# Altium schematic sheet Connector_Section.SchDoc
size A; DocumentNumber: 8; SheetNumber: 8; SheetTotal: 8
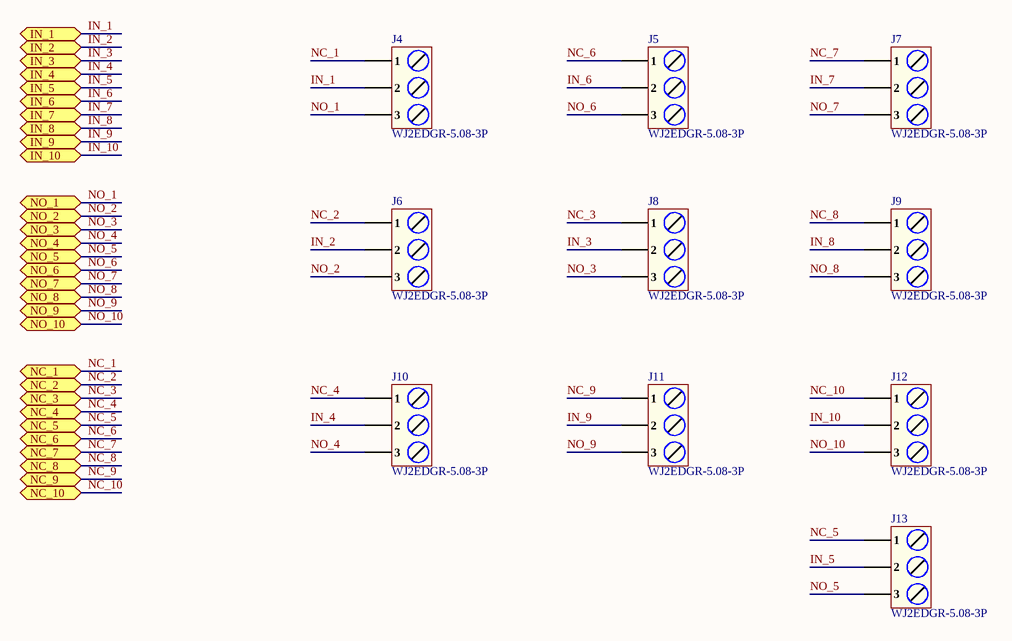
[diagram p0: Connector_Section.SchDoc]

## Parts
J4  WJ2EDGR-5.08-3P  [WJ2EDGR-5.08-3P_]
J5  WJ2EDGR-5.08-3P  [WJ2EDGR-5.08-3P_]
J6  WJ2EDGR-5.08-3P  [WJ2EDGR-5.08-3P_]
J7  WJ2EDGR-5.08-3P  [WJ2EDGR-5.08-3P_]
J8  WJ2EDGR-5.08-3P  [WJ2EDGR-5.08-3P_]
J9  WJ2EDGR-5.08-3P  [WJ2EDGR-5.08-3P_]
J10  WJ2EDGR-5.08-3P  [WJ2EDGR-5.08-3P_]
J11  WJ2EDGR-5.08-3P  [WJ2EDGR-5.08-3P_]
J12  WJ2EDGR-5.08-3P  [WJ2EDGR-5.08-3P_]
J13  WJ2EDGR-5.08-3P  [WJ2EDGR-5.08-3P_]

## Ports
IN_1 (bidir), IN_2 (bidir), IN_3 (bidir), IN_4 (bidir), IN_5 (bidir), IN_6 (bidir), IN_7 (bidir), IN_8 (bidir), IN_9 (bidir), IN_10 (bidir), NC_1 (bidir), NC_2 (bidir), NC_3 (bidir), NC_4 (bidir), NC_5 (bidir), NC_6 (bidir), NC_7 (bidir), NC_8 (bidir), NC_9 (bidir), NC_10 (bidir), NO_1 (bidir), NO_2 (bidir), NO_3 (bidir), NO_4 (bidir), NO_5 (bidir), NO_6 (bidir), NO_7 (bidir), NO_8 (bidir), NO_9 (bidir), NO_10 (bidir)

## Nets
IN_1: J4.2 ; port IN_1
IN_2: J6.2 ; port IN_2
IN_3: J8.2 ; port IN_3
IN_4: J10.2 ; port IN_4
IN_5: J13.2 ; port IN_5
IN_6: J5.2 ; port IN_6
IN_7: J7.2 ; port IN_7
IN_8: J9.2 ; port IN_8
IN_9: J11.2 ; port IN_9
IN_10: J12.2 ; port IN_10
NC_1: J4.1 ; port NC_1
NC_2: J6.1 ; port NC_2
NC_3: J8.1 ; port NC_3
NC_4: J10.1 ; port NC_4
NC_5: J13.1 ; port NC_5
NC_6: J5.1 ; port NC_6
NC_7: J7.1 ; port NC_7
NC_8: J9.1 ; port NC_8
NC_9: J11.1 ; port NC_9
NC_10: J12.1 ; port NC_10
NO_1: J4.3 ; port NO_1
NO_2: J6.3 ; port NO_2
NO_3: J8.3 ; port NO_3
NO_4: J10.3 ; port NO_4
NO_5: J13.3 ; port NO_5
NO_6: J5.3 ; port NO_6
NO_7: J7.3 ; port NO_7
NO_8: J9.3 ; port NO_8
NO_9: J11.3 ; port NO_9
NO_10: J12.3 ; port NO_10

## Library data of the parts
J4-J13 = WJ2EDGR-5.08-3P: 3 Bend 1 5.08mm Green Board Edge/Receptacle-Open Push-Pull,P=5.08mm Pluggable System Terminal Block ROHS; Manufacturer: Ningbo Kangnex Elec; Manufacturer Part Number: WJ2EDGR-5.08-3P; Package: Push-Pull,P=5.08mm; LCSC Part Number: C70914; Item Type: Terminal Block; ComponentLink1Description: LCSC; ComponentLink1URL: https://www.lcsc.com/product-detail/Pluggable-System-span-style-background-color-ff0-Terminal-span-Block_Ningbo-Kangnex-Elec-WJ2EDGR-5-08-3P_C70914.html